# Altium schematic sheet Connector miniPCIe.SchDoc: Edge connector
size A3; SheetNumber: 10; SheetTotal: 17
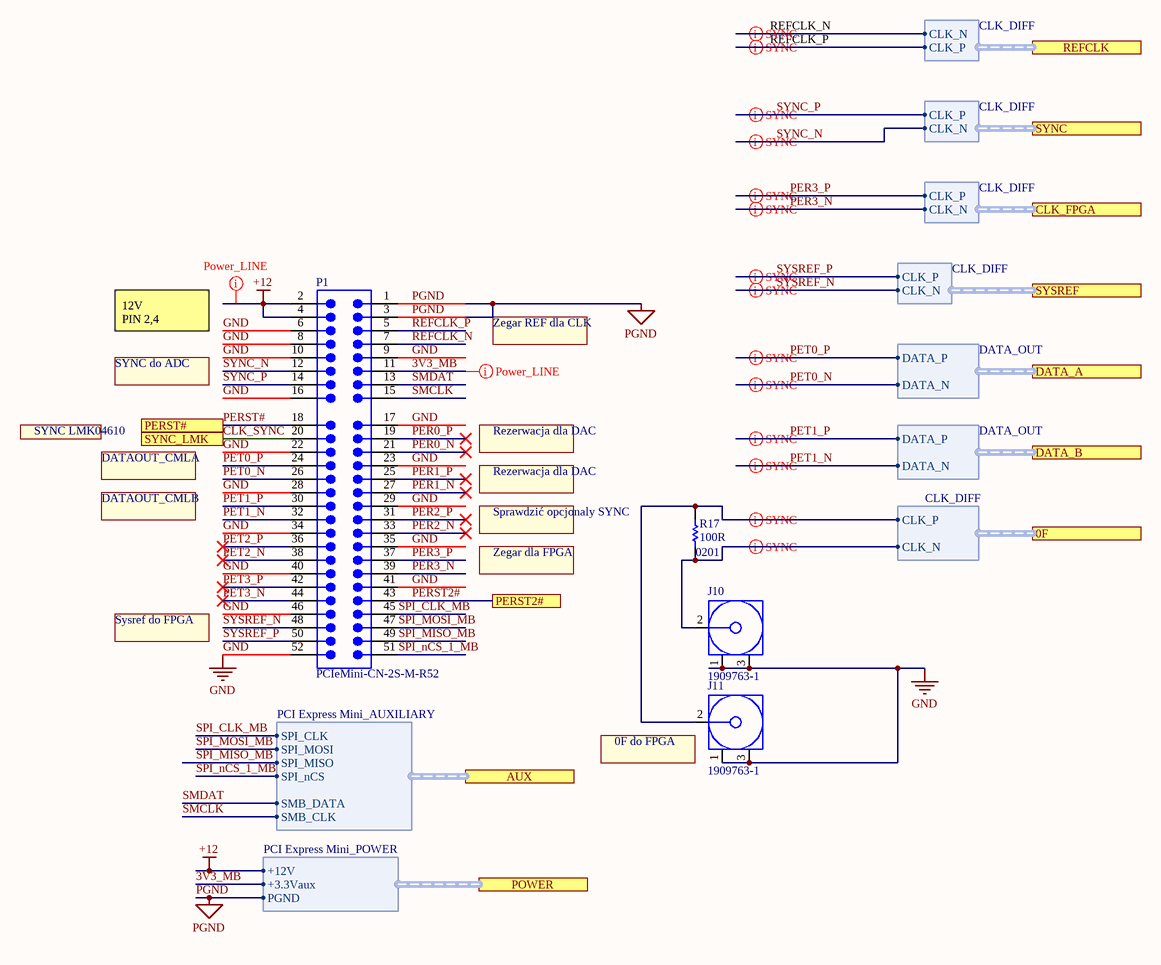
[diagram p0: Connector miniPCIe.SchDoc]

## Parts
J10  1909763-1  [TECO-1909763-1_V]
J11  1909763-1  [TECO-1909763-1_V]
P1  PCIeMini-CN-2S-M-R52  [PCIeMini-GF-2D-800-1K-S52]  (no BOM)
R17  100R  Case/Package: 0201  [RES 0201/0603]

## Ports
0F (harness CLK_DIFF), AUX (harness PCI Express Mini_AUXILIARY), CLK_FPGA (harness CLK_DIFF), DATA_A (harness DATA_OUT), DATA_B (harness DATA_OUT), PERST2#, PERST#, POWER (harness PCI Express Mini_POWER), REFCLK (harness CLK_DIFF), SYNC (harness CLK_DIFF), SYNC_LMK, SYSREF (harness CLK_DIFF)

## Harnesses
PCI Express Mini_POWER: +3.3Vaux, PGND, +12V
PCI Express Mini_AUXILIARY: SMB_DATA, SMB_CLK, SPI_nCS, SPI_MISO, SPI_MOSI, SPI_CLK
DATA_OUT: DATA_P, DATA_N
CLK_DIFF: CLK_P, CLK_N

## Nets
+12: P1.2 P1.4 ; port POWER.+12V
GND: J10.1 J10.3 J11.1 J11.3 P1.6 P1.8 P1.9 P1.10 P1.16 P1.17 P1.22 P1.23 P1.28 P1.29 P1.34 P1.35 P1.40 P1.41 P1.46 P1.52
PGND: P1.1 P1.3 ; port POWER.PGND
3V3_MB: P1.11 ; port POWER.+3.3Vaux
CLK_SYNC: P1.20 ; port SYNC_LMK
PER0_N: P1.21
PER0_P: P1.19
PER1_N: P1.27
PER1_P: P1.25
PER2_N: P1.33
PER2_P: P1.31
PER3_N: P1.39 ; port CLK_FPGA.CLK_N
PER3_P: P1.37 ; port CLK_FPGA.CLK_P
PERST2#: P1.43 ; port PERST2#
PERST#: P1.18 ; port PERST#
PET0_N: P1.26 ; port DATA_A.DATA_N
PET0_P: P1.24 ; port DATA_A.DATA_P
PET1_N: P1.32 ; port DATA_B.DATA_N
PET1_P: P1.30 ; port DATA_B.DATA_P
PET2_N: P1.38
PET2_P: P1.36
PET3_N: P1.44
PET3_P: P1.42
REFCLK_N: P1.7 ; port REFCLK.CLK_N
REFCLK_P: P1.5 ; port REFCLK.CLK_P
SMCLK: P1.15 ; port AUX.SMB_CLK
SMDAT: P1.13 ; port AUX.SMB_DATA
SPI_CLK_MB: P1.45 ; port AUX.SPI_CLK
SPI_MISO_MB: P1.49 ; port AUX.SPI_MISO
SPI_MOSI_MB: P1.47 ; port AUX.SPI_MOSI
SPI_nCS_1_MB: P1.51 ; port AUX.SPI_nCS
SYNC_N: P1.12 ; port SYNC.CLK_N
SYNC_P: P1.14 ; port SYNC.CLK_P
SYSREF_N: P1.48 ; port SYSREF.CLK_N
SYSREF_P: P1.50 ; port SYSREF.CLK_P
NetJ10_2: J10.2 R17.1 ; port 0F.CLK_N
NetJ11_2: J11.2 R17.2 ; port 0F.CLK_P

## Layout directives
differential pair; differential pair class DIFF_100: NetJ10_2, NetJ11_2, PER3_N, PER3_P, PET0_N, PET0_P, PET1_N, PET1_P, REFCLK_N, REFCLK_P, SYNC_N, SYNC_P, SYSREF_N, SYSREF_P
net class Power_LINE: 3V3_MB, +12

## Notes on the sheet
- 12V
  PIN 2,4
- Zegar REF dla CLK
- SYNC do ADC
- SYNC LMK04610
- DATAOUT_CMLA
- Rezerwacja dla DAC
- DATAOUT_CMLB
- Sprawdzić opcjonaly SYNC
- Zegar dla FPGA
- Sysref do FPGA
- (near J11) 0F do FPGA
- Title
- Size:
- Date:
- A3
- Number:
- Time:
- Revision:
- Sheet
- of
- File:

## Library data of the parts
J10 J11 = 1909763-1: Ultra Miniature Coaxial Connector Jack, 60 V, 50 Ohm, -40 to 90 degC, RoHS, Tape and Reel; Brand: TE Connectivity / AMP; Maximum Frequency: 6 GHz; Gender: Jack (Female); Body Material: Liquid Crystal Polymer (LCP); RF Series: UMCC; Impedance: 50 Ohms; DatasheetVersion: Rev. B2; PackageReference: SMD; PackageDescription: 3-Pin Surface Mount Device, Body 2.6 x 2.6 mm; Supplier 1: Newark; Supplier Part Number 1: 62X0488; Supplier 2: Farnell; Supplier Part Number 2: 2781689; Supplier 3: Digi-Key; Supplier Part Number 3: A118077TR-ND; Supplier 4: Digi-Key; Supplier Part Number 4: A118077CT-ND; Supplier 5: Digi-Key; Supplier Part Number 5: A118077DKR-ND; Product Category: RF Connectors / Coaxial Connectors; Packaging: Reel; Product: Connectors; Orientation: Straight; Operating Temperature Range: - 40 C to + 90 C; Factory Pack Quantity: 5000; RoHS: Details; Contact Plating: Gold; Contact Material: Copper Alloy; Mounting Technology: Surface Mount; ComponentLink1Description: Manufacturer URL; ComponentLink1URL: http://www.te.com; ComponentLink2Description: Datasheet; ComponentLink2URL: http://www.te.com/commerce/DocumentDelivery/DDEController?Action=srchrtrv&DocNm=1909763&DocType=Customer+Drawing&DocLang=English
P1 = CMP-0001-00067-2: Golden finger, PCIeMini, Dual, Staggered, Pitch 0.8mm, 52-Position; Mating Connector: Tyco-292443-1; Package Version: rev1.2, Oct-2007; Publisher: Altium; Package Reference: PCIeMini-GF-2D-800-1K-S52; ClassName: Edge Connector; Datasheet Version: Revision 1.2 Oct-2007
R17 = Resistor: Res Thick Film 0201 100 Ohm 1% 1/20W 200ppm/C Molded SMD SMD Paper T/R; Manufacturer: Yageo; Manufacturer Part Number: RC0201FR-07100RL; Power Rating: 50mW; Voltage Rating: 25V; Temperature Coefficient: 200ppm/°C; Supplier 1: Digi-Key; Supplier Part Number 1: 311-100MCT-ND; RoHS: Yes; Category: Chip SMD Resistors; Stock 1: 576597; Pricing 1: 1=0,10000, 10=0,04000, 100=0,01650, 1000=0,00739, 2500=0,00642, 5000=0,00530 (USD); Case Code (Metric): 0603; Case Code (Imperial): 0201; Contact Plating: Tin,Matte; Min Operating Temperature: -55°C; Max Operating Temperature: 125°C; Resistance: 100R; Tolerance: 1%; Packaging: Tape and Reel; Package Quantity: 1; Max Power Dissipation: 50mW; Composition: Thick Film; Number of Terminations: 2; Termination: SMD/SMT; Features: Moisture Resistant; Length: 0.024inch; Height: 0.01inch; Width: 0.012inch; Radiation Hardening: No; REACH SVHC: Unknown; Lead Free: Lead Free; ComponentLink1URL: https://datasheet.ciiva.com/2560/pyu-r-int-thick-7-2560866.pdf?src-supplier=Digi-Key; ComponentLink1Description: https://datasheet.ciiva.com/2560/pyu-r-int-thick-7-2560866.pdf?src-supplier=Digi-Key; ComponentLink2URL: https://datasheet.ciiva.com/28395/pyu-rc0201-51-rohs-l-8-28395391.pdf?src-supplier=Avnet+Europe; ComponentLink2Description: https://datasheet.ciiva.com/28395/pyu-rc0201-51-rohs-l-8-28395391.pdf?src-supplier=Avnet+Europe; ComponentLink3URL: https://datasheet.ciiva.com/2560/pyu-r-int-thick-7-2560865.pdf?src-supplier=Digi-Key; ComponentLink3Description: https://datasheet.ciiva.com/2560/pyu-r-int-thick-7-2560865.pdf?src-supplier=Digi-Key; ComponentLink4URL: https://datasheet.ciiva.com/2560/pyu-r-int-thick-7-2560867.pdf?src-supplier=Digi-Key; ComponentLink4Description: https://datasheet.ciiva.com/2560/pyu-r-int-thick-7-2560867.pdf?src-supplier=Digi-Key; ComponentLink5URL: https://datasheet.ciiva.com/16855/pyu-rc0201-51-rohs-l-8-16855781.pdf?src-supplier=Avnet+Europe; ComponentLink5Description: https://datasheet.ciiva.com/16855/pyu-rc0201-51-rohs-l-8-16855781.pdf?src-supplier=Avnet+Europe; ComponentLink6URL: https://datasheet.ciiva.com/8887/pyu-rc0201-51-rohs-l-8-8887865.pdf?src-supplier=Avnet; ComponentLink6Description: https://datasheet.ciiva.com/8887/pyu-rc0201-51-rohs-l-8-8887865.pdf?src-supplier=Avnet